# EasyEDA Pro project cv_control_expansion_board.epro

# Schematic Schematic1
Assembly Variant: Basic; Board Name: Board1; Create Date: 2026-10-17; Page Name: P1; Project Name: 26cv测试主控拓展版; Schematic Name: Schematic1; Update Date: 2026-10-17; Company: 嘉立创EDA; Page Size: A4; Version: V1.0
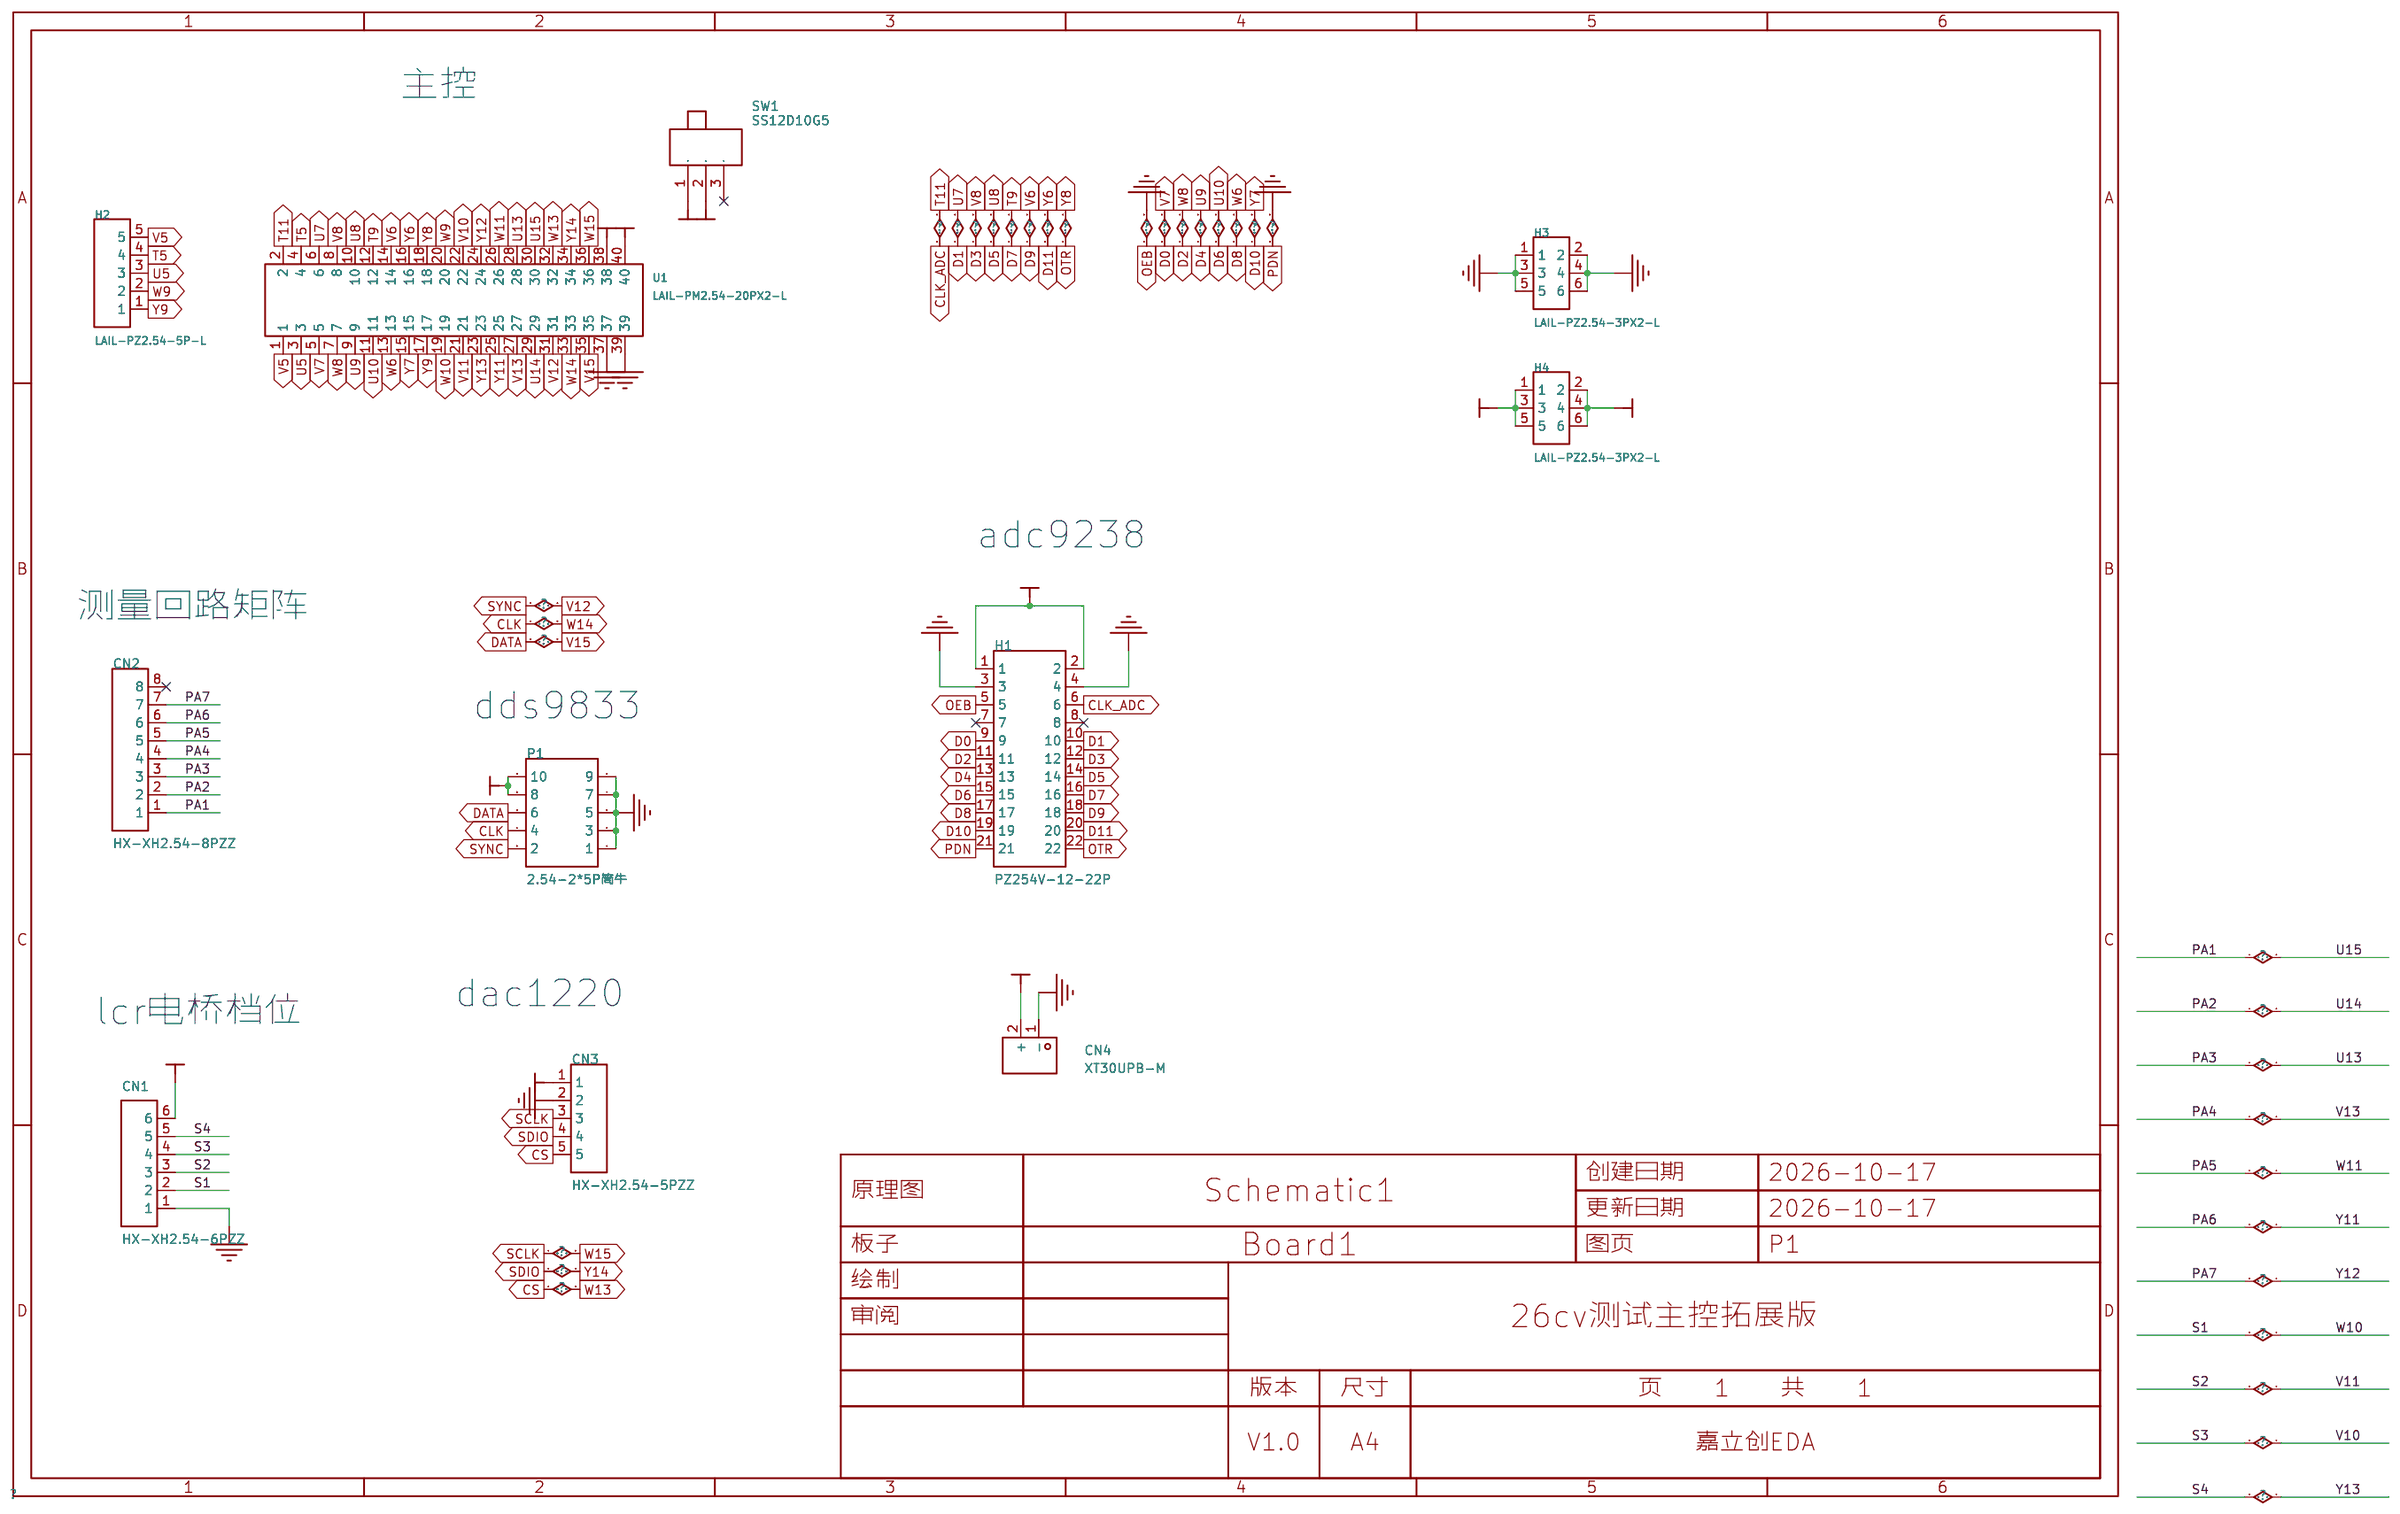
[diagram p0: schematic sheet]

## Parts
CN1  HX-XH2.54-6PZZ  [CONN-TH_6P-P2.50_BX-XH2.54-6PZZ]
CN2  HX-XH2.54-8PZZ  [CONN-TH_8P-P2.50_HC-XH-8A-G]
CN3  HX-XH2.54-5PZZ  [CONN-TH_5P-P2.50_ZX-XH2.54-5PZZ]
CN4  XT30UPB-M  [CONN-TH_XT30UPB-M]
H1  PZ254V-12-22P  [HDR-TH_22P-P2.54-V-M-R2-C11-S2.54]
H2  LAIL-PZ2.54-5P-L  [CONN-TH_LAIL-PZ2.54-5P-L]
H3  LAIL-PZ2.54-3PX2-L  [HDR-TH_LAIL-PZ2.54-3PX2-L]
H4  LAIL-PZ2.54-3PX2-L  [HDR-TH_LAIL-PZ2.54-3PX2-L]
P1  2.54-2*5P简牛  [IDC-TH_10P-P2.54_C5665]
SW1  SS12D10G5  [SW-TH_3P-P4.8-L12.7-W6.7_SS12D10G3]
U1  LAIL-PM2.54-20PX2-L  [HDR-TH_LAIL-PM2.54-20PX2-L]

## Library data of the parts
CN1 = HX-XH2.54-6PZZ: 插针结构:1x6P;间距:2.54mm;安装方式:直插;参考系列:XH;总PIN数:6P;排数:1;每排PIN数:6;行距:-;额定电流:3A;触头材质:黄铜;触头镀层:锡;工作温度:-25℃~+85℃;; LCSC Part Name: 1x6P 间距:2.54mm 直插 系列:XH; Supplier Part: C42391664; Manufacturer: hanxia(韩下); Supplier Footprint: 插件,P=2.5mm; JLCPCB Part Class: Extended Part; Datasheet: https://item.szlcsc.com/datasheet/HX-XH2.54-6PZZ/44326936.html; Supplier: LCSC; Pins Structure: 1x6P; Pitch: 2.54mm; Mounting Type: 直插; Reference Series: XH; Number of Pins: 6P; Number of Rows: 1; Number of PINs Per Row: 6; Current Rating: 3A; Contact Material: 黄铜; Contact Plating: 锡; Operating Temperature: -25℃~+85℃; Voltage Rating: 250V; Plastic Material: PA66; Flame Retardant Rating: UL94V-0; Color: 白色
CN2 = HX-XH2.54-8PZZ: 插针结构:1x8P;间距:2.5mm;安装方式:直插;参考系列:XH;总PIN数:8P;排数:1;每排PIN数:8;行距:-;额定电流:3A;触头材质:黄铜;触头镀层:锡;工作温度:-25℃~+85℃;; LCSC Part Name: 1x8P 间距:2.5mm 直插 系列:XH; Supplier Part: C48641712; Manufacturer: hanxia(韩下); Supplier Footprint: 插件,P=2.5mm; JLCPCB Part Class: Extended Part; Datasheet: https://item.szlcsc.com/datasheet/HX-XH2.54-8PZZ/50919908.html; Supplier: LCSC; Pins Structure: 1x8P; Pitch: 2.5mm; Mounting Type: 直插; Reference Series: XH; Number of Pins: 8P; Number of Rows: 1; Number of PINs Per Row: 8; Current Rating: 3A; Contact Material: 黄铜; Contact Plating: 锡; Operating Temperature: -25℃~+85℃; Voltage Rating: 250V; Plastic Material: PA66; Flame Retardant Rating: UL94V-0; Color: 白色
CN3 = HX-XH2.54-5PZZ: 插针结构:1x5P;间距:2.54mm;安装方式:直插;参考系列:XH;总PIN数:5P;排数:1;每排PIN数:5;行距:-;额定电流:3A;触头材质:黄铜;触头镀层:锡;工作温度:-25℃~+85℃;; LCSC Part Name: 1x5P 间距:2.5mm 直插 系列:XH; Supplier Part: C42391663; Manufacturer: hanxia(韩下); Supplier Footprint: 插件,P=2.5mm; JLCPCB Part Class: Extended Part; Datasheet: https://item.szlcsc.com/datasheet/HX-XH2.54-5PZZ/44326935.html; Supplier: LCSC; Pins Structure: 1x5P; Pitch: 2.54mm; Mounting Type: 直插; Reference Series: XH; Number of Pins: 5P; Number of Rows: 1; Number of PINs Per Row: 5; Current Rating: 3A; Contact Material: 黄铜; Contact Plating: 锡; Operating Temperature: -25℃~+85℃; Voltage Rating: 250V; Plastic Material: PA66; Flame Retardant Rating: UL94V-0; Color: 白色
CN4 = XT30UPB-M: LCSC Part Name: AMASS(艾迈斯)板载立式 航模锂电池控制器连接器插头 PCB板立式 公头XT30UPB-M.G.Y; Supplier Part: C428721; Manufacturer: AMASS(艾迈斯); JLCPCB Part Class: Extended Part; Datasheet: https://item.szlcsc.com/datasheet/XT30UPB-M/423831.html; Supplier: LCSC; Rated current: 15A; Rated voltage: 500VDC; colour: 黄色; Connector type: 航模插头; contact resistance: 0.65mΩ; interface form: 公头; insulating material: PA; metal material: 镀金
H1 = PZ254V-12-22P: 插针结构:2x11P;间距:2.54mm;行距:2.54mm;圆针/方针:方针;安装方式:直插;排数:双排;总PIN位数:22P;额定电流:-;额定电压:-;配合针长度:6mm;塑高:2.5mm;端接针长度:3mm;触头材质:黄铜;触头镀层:-;工作温度:-40℃~+105℃;颜色:黑色;; LCSC Part Name: 2x11P 间距:2.54mm 方针 直插; Supplier Part: C492428; Manufacturer: XFCN(兴飞); Supplier Footprint: 插件,P=2.54mm; JLCPCB Part Class: Extended Part; Datasheet: https://item.szlcsc.com/datasheet/PZ254V-12-22P/502984.html; Supplier: LCSC; Pin Structure: 2x11P; Pitch: 2.54mm; Row Spacing: 2.54mm; Circluar Pins/Square Pins: 方针; Mounting Type: 直插; Number of Rows: 双排; Number of Pins: 22P; Length of Mating Pin: 6mm; Insulation Height: 2.5mm; Length of End Connection Pin: 3mm; Contact Material: 黄铜; Operating Temperature: -40℃~+105℃; Color: 黑色
H2 = LAIL-PZ2.54-5P-L: 插针结构:1x5P;间距:2.54mm;圆针/方针:方针;安装方式:直插;排数:单排;总PIN位数:5P;额定电流:3A;额定电压:250V;配合针长度:6mm;塑高:2.5mm;端接针长度:3mm;触头材质:黄铜;触头镀层:金;工作温度:-25℃~+80℃;颜色:黑色;; LCSC Part Name: 1x5P 间距:2.54mm 方针 直插; Supplier Part: C54950605; Manufacturer: LAILAN(莱联); Supplier Footprint: 插件,P=2.54mm; JLCPCB Part Class: Extended Part; Datasheet: https://item.szlcsc.com/datasheet/LAIL-PZ2.54-5P-L/58519958.html; Supplier: LCSC; Pin Structure: 1x5P; Pitch: 2.54mm; Circluar Pins/Square Pins: 方针; Mounting Type: 直插; Number of Rows: 单排; Number of Pins: 5P; Current Rating: 3A; Voltage Rating (Max): 250V; Length of Mating Pin: 6mm; Insulation Height: 2.5mm; Length of End Connection Pin: 3mm; Contact Material: 黄铜; Contact Plating: 金; Operating Temperature: -25℃~+80℃; Color: 黑色
H3 H4 = LAIL-PZ2.54-3PX2-L: 插针结构:2x3P;间距:2.54mm;行距:2.54mm;圆针/方针:方针;安装方式:直插;排数:双排;总PIN位数:6P;额定电流:3A;额定电压:250V;配合针长度:6mm;塑高:2.5mm;端接针长度:3mm;触头材质:黄铜;触头镀层:金;工作温度:-25℃~+80℃;颜色:黑色;; LCSC Part Name: 2x3P 间距:2.54mm 方针 直插; Supplier Part: C54950606; Manufacturer: LAILAN(莱联); Supplier Footprint: 插件,P=2.54mm; JLCPCB Part Class: Extended Part; Datasheet: https://item.szlcsc.com/datasheet/LAIL-PZ2.54-3PX2-L/58519959.html; Supplier: LCSC; Pin Structure: 2x3P; Pitch: 2.54mm; Row Spacing: 2.54mm; Circluar Pins/Square Pins: 方针; Mounting Type: 直插; Number of Rows: 双排; Number of Pins: 6P; Current Rating: 3A; Voltage Rating (Max): 250V; Length of Mating Pin: 6mm; Insulation Height: 2.5mm; Length of End Connection Pin: 3mm; Contact Material: 黄铜; Contact Plating: 金; Operating Temperature: -25℃~+80℃; Color: 黑色
P1 = 2.54-2*5P简牛: 连接器类型:简牛座;间距:2.54mm;结构:2x5P;额定电流:1A;安装方式:直插;行距:2.54mm;排数:2;每排PIN数:5;触头材质:黄铜;触头镀层:金;工作温度:-55℃~+105℃;; LCSC Part Name: 2.54mm 2x5P 排数:2 每排P数:5; Supplier Part: C5665; Manufacturer: BOOMELE(博穆精密); Supplier Footprint: 插件,P=2.54mm; JLCPCB Part Class: Extended Part; Supplier: LCSC; Connector Type: 简牛座; Pitch: 2.54mm; Number of Positions or Pins: 2x5P; Current Rating: 1A; Holder Type: 直插; Row Spacing: 2.54mm; Number of Rows: 2; Number of PINs Per Row: 5; Contact Material: 黄铜; Contact Plating: 金; Operating Temperature: -55℃~+105℃; Color: 黑色
SW1 = SS12D10G5_C48601059: 电路结构:单刀双掷;安装方式:直插;开关颜色:黑色;额定电流:2A;额定电压:125V;; LCSC Part Name: 单刀双掷拨动开关; Supplier Part: C48601059; Manufacturer: HanElectricity(瀚源); Supplier Footprint: 插件; JLCPCB Part Class: Extended Part; Datasheet: https://item.szlcsc.com/datasheet/SS12D10G5/50871455.html; Supplier: LCSC; Circuit: 单刀双掷; Actuator Style: 矩形柱状; Termination Style: PC引脚; Length: 12.7mm; Width: 6.7mm; Mounting Type: 直插; Actuator Color: 黑色; Current Rating: 2A; Voltage Rating: 125V; Operating Temperature: -16℃~+60℃
U1 = LAIL-PM2.54-20PX2-L: 插孔结构:2x20P;间距:2.54mm;行距:2.54mm;圆孔/方孔:方孔;安装方式:直插;排数:双排;总孔位数:40P;额定电流:3A;额定电压:250V;插孔方向:顶部;塑高:8.5mm;触头材质:黄铜;触头镀层:金;工作温度:-25℃~+80℃;; LCSC Part Name: 2x20P 间距:2.54mm 直插; Supplier Part: C54973827; Manufacturer: 莱联; Supplier Footprint: 插件,P=2.54mm; JLCPCB Part Class: Extended Part; Datasheet: https://item.szlcsc.com/datasheet/LAIL-PM2.54-20PX2-L/58554905.html; Supplier: LCSC; Holes Structure: 2x20P; Pitch: 2.54mm; Row Spacing: 2.54mm; Circular Hole / Square Hole: 方孔; Mounting Type: 直插; Number of Rows: 双排; Number of Positions: 40P; Current Rating: 3A; Voltage Rating (Max): 250V; Holes Direction: 顶部; Insulation Height: 8.5mm; Contact Material: 黄铜; Contact Plating: 金; Operating Temperature: -25℃~+80℃; PIN Length: 3mm

## Nets
3V3: U1.38
5V: SW1.1 U1.40
+5VCC: CN1.6 CN3.1 CN4.2(+) H1.1 H1.2 H4.1 H4.2 H4.3 H4.4 H4.5 H4.6 P1.8 P1.10 SW1.2
GND: CN1.1 CN3.2 CN4.1(-) H1.3 H1.4 H1.5 H1.21 H3.1 H3.2 H3.3 H3.4 H3.5 H3.6 P1.1 P1.3 P1.5 P1.7 P1.9 U1.37 U1.39
V5: H2.5 U1.1
CLK: P1.4 U1.33
CLK_ADC: H1.6 U1.2
CS: CN3.5 U1.32
D0: H1.9 U1.5
D1: H1.10 U1.6
D2: H1.11 U1.7
D3: H1.12 U1.8
D4: H1.13 U1.9
D5: H1.14 U1.10
D6: H1.15 U1.11
D7: H1.16 U1.12
D8: H1.17 U1.13
D9: H1.18 U1.14
D10: H1.19 U1.15
D11: H1.20 U1.16
DATA: P1.6 U1.35
OTR: H1.22 U1.18
PA1: CN2.1 U1.30
PA2: CN2.2 U1.29
PA3: CN2.3 U1.28
PA4: CN2.4 U1.27
PA5: CN2.5 U1.26
PA6: CN2.6 U1.25
PA7: CN2.7 U1.24
S1: CN1.2 U1.19
S2: CN1.3 U1.21
S3: CN1.4 U1.22
S4: CN1.5 U1.23
SCLK: CN3.3 U1.36
SDIO: CN3.4 U1.34
SYNC: P1.2 U1.31
T5: H2.4 U1.4
U5: H2.3 U1.3
W9: H2.2 U1.20
Y9: H2.1 U1.17

Not connected (* = marked no-connect by the designer): CN2 8*; H1 7* 8*; SW1 3*

## Notes on the sheet
- 主控
- adc9238
- 测量回路矩阵
- dds9833
- dac1220
- lcr电桥档位

# Board PCB1
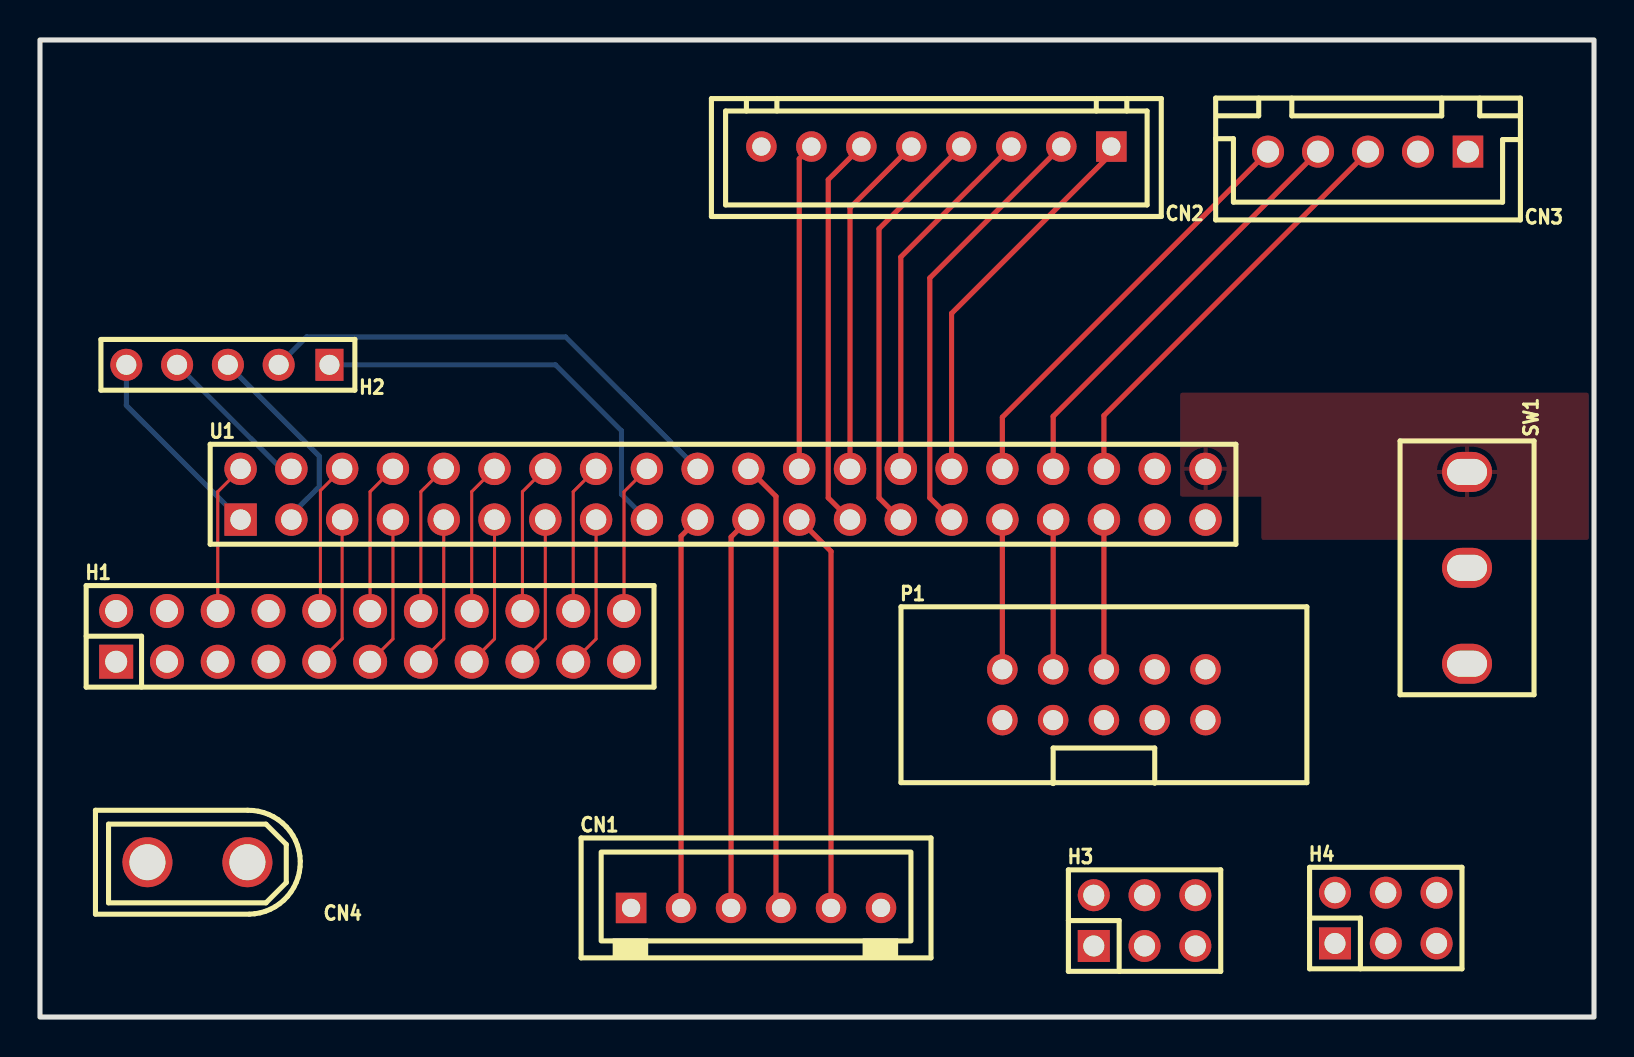
[diagram p1: board, top side]
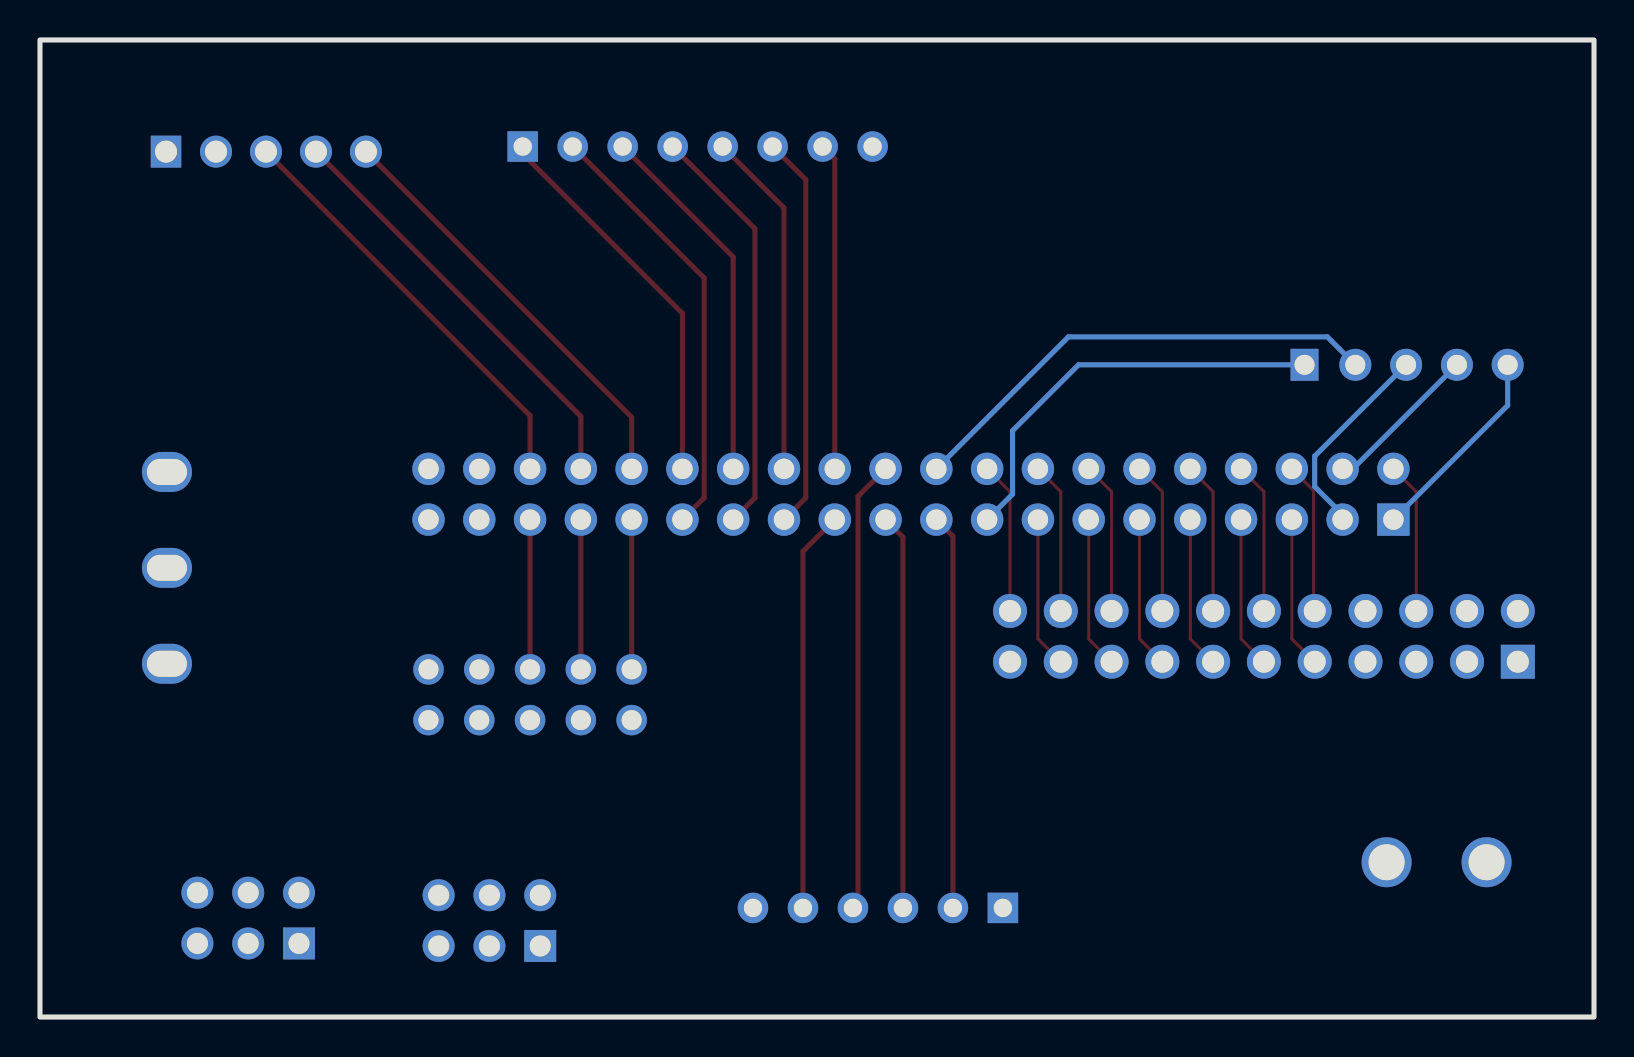
[diagram p2: board, bottom side, seen from below]

Outline 77.72 x 48.89 mm; copper layers: Top Layer, Inner1, Inner2, Bottom Layer. Coordinates in mm from the lower left corner of the outline.
Outline path: rectangle 0,48.89 77.72,0
Stack: Top Layer 0.035mm Outer layer thickness 1oz / Dielectric1 0.2104mm 7628 RC49% 8.6mil er 4.4 / Inner1 0.0152mm Inner layer thickness / Dielectric2 1.065mm 1.1mm H/HOZ Copper er 4.43 / Inner2 0.0152mm Inner layer thickness / Dielectric3 0.2104mm 7628 RC49% 8.6mil er 4.4 / Bottom Layer 0.035mm Outer layer thickness 1oz

## Design rules (mm)
spacing copperThickness1oz (default): track to track 0.102, other pairs 0.152 to 0.3
spacing copperThickness2oz: track to track 0.203, other pairs 0.152 to 0.3
track width copperThickness1oz (default): min 0.127, default 0.254, max 2.54
track width copperThickness2oz: min 0.203, default 0.254, max 2.54
differential pair differentialPair (default): width min 0.127, default 0.254, max 2.54; gap min 0.152, default 0.152
net 5V uses copperRegion

## Placement (name value [footprint] x y rotation side)
CN1  HX-XH2.54-6PZZ  [CONN-TH_6P-P2.50_BX-XH2.54-6PZZ]  35.81 5.46 0 top
CN2  HX-XH2.54-8PZZ  [CONN-TH_8P-P2.50_HC-XH-8A-G]  44.83 43.56 180 top
CN3  HX-XH2.54-5PZZ  [CONN-TH_5P-P2.50_ZX-XH2.54-5PZZ]  66.42 43.31 180 top
CN4  XT30UPB-M  [CONN-TH_XT30UPB-M]  7.87 7.75 180 top
H1  PZ254V-12-22P  [HDR-TH_22P-P2.54-V-M-R2-C11-S2.54]  16.51 19.05 0 top
H2  LAIL-PZ2.54-5P-L  [CONN-TH_LAIL-PZ2.54-5P-L]  9.4 32.64 180 top
H3  LAIL-PZ2.54-3PX2-L  [HDR-TH_LAIL-PZ2.54-3PX2-L]  55.25 4.83 0 top
H4  LAIL-PZ2.54-3PX2-L  [HDR-TH_LAIL-PZ2.54-3PX2-L]  67.31 4.95 0 top
P1  2.54-2*5P简牛  [IDC-TH_10P-P2.54_C5665]  53.21 16.13 0 top
SW1  SS12D10G5  [SW-TH_3P-P4.8-L12.7-W6.7_SS12D10G3]  71.37 22.48 270 top
U1  LAIL-PM2.54-20PX2-L  [HDR-TH_LAIL-PM2.54-20PX2-L]  34.16 26.16 0 top

## Footprints (pads in the part's own frame, mm; a bottom-side part is the same pattern mirrored in y, then rotated)
CONN-TH_5P-P2.50_ZX-XH2.54-5PZZ
  rect 1.524x1.6 hole 1.1: 1(-5,0)
  round 1.6 hole 1.1: 2(-2.5,0) 3(0,0) 4(2.5,0) 5(5,0)
CONN-TH_6P-P2.50_BX-XH2.54-6PZZ
  rect 1.524x1.524 hole 0.914: 1(-6.25,0)
  round 1.524 hole 0.914: 2(-3.75,0) 3(-1.25,0) 4(1.25,0) 5(3.75,0) 6(6.25,0)
CONN-TH_8P-P2.50_HC-XH-8A-G
  rect 1.524x1.524 hole 0.914: 1(-8.75,0)
  round 1.524 hole 0.914: 2(-6.25,0) 3(-3.75,0) 4(-1.25,0) 5(1.25,0) 6(3.75,0) 7(6.25,0) 8(8.75,0)
CONN-TH_LAIL-PZ2.54-5P-L
  rect 1.4x1.6 hole 1: 1(-5.08,0)
  round 1.6 hole 1: 2(-2.54,0) 3(0,0) 4(2.54,0) 5(5.08,0)
CONN-TH_XT30UPB-M
  round 2.5 hole 1.8: 1(-2.5,0) 2(2.5,0)
HDR-TH_22P-P2.54-V-M-R2-C11-S2.54
  rect 1.7x1.7 hole 1.1: 1(-12.7,-1.27)
  round 1.7 hole 1.1: 2(-12.7,1.27) 3(-10.16,-1.27) 4(-10.16,1.27) 5(-7.62,-1.27) 6(-7.62,1.27) 7(-5.08,-1.27) 8(-5.08,1.27) 9(-2.54,-1.27) 10(-2.54,1.27) 11(0,-1.27) 12(0,1.27) 13(2.54,-1.27) 14(2.54,1.27) 15(5.08,-1.27) 16(5.08,1.27) 17(7.62,-1.27) 18(7.62,1.27) 19(10.16,-1.27) 20(10.16,1.27) 21(12.7,-1.27) 22(12.7,1.27)
HDR-TH_LAIL-PM2.54-20PX2-L
  rect 1.62x1.62 hole 1.02: 1(-24.13,-1.27)
  round 1.62 hole 1.02: 2(-24.13,1.27) 3(-21.59,-1.27) 4(-21.59,1.27) 5(-19.05,-1.27) 6(-19.05,1.27) 7(-16.51,-1.27) 8(-16.51,1.27) 9(-13.97,-1.27) 10(-13.97,1.27) 11(-11.43,-1.27) 12(-11.43,1.27) 13(-8.89,-1.27) 14(-8.89,1.27) 15(-6.35,-1.27) 16(-6.35,1.27) 17(-3.81,-1.27) 18(-3.81,1.27) 19(-1.27,-1.27) 20(-1.27,1.27) 21(1.27,-1.27) 22(1.27,1.27) 23(3.81,-1.27) 24(3.81,1.27) 25(6.35,-1.27) 26(6.35,1.27) 27(8.89,-1.27) 28(8.89,1.27) 29(11.43,-1.27) 30(11.43,1.27) 31(13.97,-1.27) 32(13.97,1.27) 33(16.51,-1.27) 34(16.51,1.27) 35(19.05,-1.27) 36(19.05,1.27) 37(21.59,-1.27) 38(21.59,1.27) 39(24.13,-1.27) 40(24.13,1.27)
HDR-TH_LAIL-PZ2.54-3PX2-L
  rect 1.6x1.6 hole 1.05: 1(-2.54,-1.27)
  round 1.6 hole 1.05: 2(-2.54,1.27) 3(0,-1.27) 4(0,1.27) 5(2.54,-1.27) 6(2.54,1.27)
IDC-TH_10P-P2.54_C5665
  round 1.524 hole 1: 1(-5.08,-1.27) 2(-5.08,1.27) 3(-2.54,-1.27) 4(-2.54,1.27) 5(0,-1.27) 6(0,1.27) 7(2.54,-1.27) 8(2.54,1.27) 9(5.08,-1.27) 10(5.08,1.27)
SW-TH_3P-P4.8-L12.7-W6.7_SS12D10G3
  oval 2x2.5 hole 1.3x2: 1(-4.8,0) 2(0,0) 3(4.8,0)

## Nets
As in the schematic.

Pads without a net: CN2 8; H1 7 8; SW1 3

## Routing (per net, layer and track width the routed paths; a pad name or vN(x,y) marks a point on that pad's centre or on a via; arc(x,y) is an arc through that point)
V5: length 10.1
  Bottom Layer w0.254: H2.5 4.32,30.61 10.03,24.89
CLK: length 7.5
  Top Layer w0.254: 50.67,17.4 U1.33
CLK_ADC: length 7.6
  Top Layer w0.152: H1.6 8.89,26.29 10.03,27.43
CS: length 21.4
  Top Layer w0.254: CN3.5 48.13,30.02 U1.32
D0: length 7.6
  Top Layer w0.152: H1.9 15.11,18.92 15.11,24.89
D1: length 7.6
  Top Layer w0.152: H1.10 14.02,20.37 14.02,26.34 15.11,27.43
D2: length 7.6
  Top Layer w0.152: H1.11 17.65,18.92 U1.7
D3: length 7.6
  Top Layer w0.152: U1.8 16.51,26.29 H1.12
D4: length 7.6
  Top Layer w0.152: H1.13 20.19,18.92 U1.9
D5: length 7.6
  Top Layer w0.152: H1.14 19.05,26.29 U1.10
D6: length 7.6
  Top Layer w0.152: H1.15 22.73,18.92 U1.11
D7: length 7.6
  Top Layer w0.152: H1.16 21.59,26.29 U1.12
D8: length 7.6
  Top Layer w0.152: H1.17 25.27,18.92 25.27,24.89
D9: length 7.6
  Top Layer w0.152: 25.27,27.43 24.13,26.29 H1.18
D10: length 7.6
  Top Layer w0.152: H1.19 27.81,18.92 27.81,24.89
D11: length 7.6
  Top Layer w0.152: 27.81,27.43 26.67,26.29 H1.20
DATA: length 7.5
  Top Layer w0.254: 53.21,17.4 53.21,24.89
OTR: length 7.6
  Top Layer w0.152: H1.22 29.21,26.29 U1.18
PA1: length 19.4
  Top Layer w0.254: CN2.1 53.58,43.2 45.59,35.21 45.59,27.43
PA2: length 21.8
  Top Layer w0.254: CN2.2 44.5,36.98 44.5,25.98 45.59,24.89
PA3: length 18.4
  Top Layer w0.254: CN2.3 43.05,38.03 U1.28
PA4: length 20.8
  Top Layer w0.254: CN2.4 41.96,39.44 41.96,25.98 U1.27
PA5: length 17.4
  Top Layer w0.254: CN2.5 40.51,40.49 U1.26
PA6: length 19.8
  Top Layer w0.254: U1.25 39.42,25.98 39.42,41.9 CN2.6
PA7: length 16.4
  Top Layer w0.254: U1.24 37.97,42.95 CN2.7
S1: length 19.8
  Top Layer w0.254: CN1.2 32.06,24.06 U1.19
S2: length 19.8
  Top Layer w0.254: CN1.3 34.56,24.02 35.43,24.89
S3: length 22.6
  Top Layer w0.254: 35.43,27.43 36.81,26.05 36.81,5.72 CN1.4
S4: length 20.1
  Top Layer w0.254: U1.23 39.56,23.3 CN1.5
SCLK: length 21.3
  Top Layer w0.254: 53.21,27.43 53.21,30.1 CN3.3
SDIO: length 21.4
  Top Layer w0.254: CN3.4 50.67,30.06 U1.34
SYNC: length 7.5
  Top Layer w0.254: 48.13,17.4 U1.31
T5: length 7.9
  Bottom Layer w0.254: 12.57,27.43 12.06,27.43 H2.4
U5: length 10.2
  Bottom Layer w0.254: 12.57,24.89 12.57,25.15 13.97,26.54 13.97,28.07 H2.3
W9: length 24.3
  Bottom Layer w0.254: U1.20 26.29,34.04 13.33,34.04 H2.2
Y9: length 20.9
  Bottom Layer w0.254: H2.1 25.78,32.64 29.08,29.34 29.08,26.16 U1.17

## Copper pours and planes (outline as drawn; the poured copper is in the pictures)
5V on Top Layer: 57.02,26.03 57.02,31.24 77.47,31.24 77.47,23.88 61.09,23.88 61.09,26.03
+5VCC on Inner2: 0.26,48.64 77.47,48.64 77.47,0.26 0.26,0.26
GND on Inner1: 0.26,48.64 77.47,48.64 77.47,0.26 0.26,0.26

Small or netless copper shapes (teardrops, artwork), in the pictures only: 80 on Inner1, 56 on Inner2
